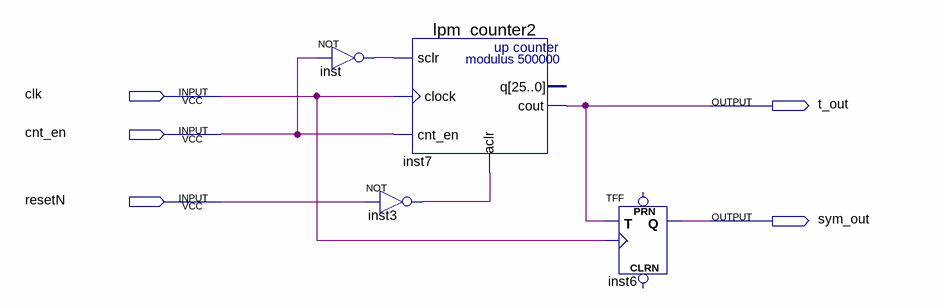
[diagram p0: schematic sheet]
// Quartus schematic secgen.bdf as structural Verilog: 4 symbols, 5 pins
module secgen (
  input  clk,
  input  cnt_en,
  input  resetN,
  output t_out,
  output sym_out
);

  wire inst3_out, inst_out;

  not inst (inst_out, cnt_en);
  lpm_counter2 inst7 (.sclr(inst_out), .clock(clk), .cnt_en(cnt_en), .aclr(inst3_out), .cout(t_out));  // open: q
  not inst3 (inst3_out, resetN);
  TFF inst6 (.T(t_out), .CLK(clk), .Q(sym_out));  // open: PRN, CLRN
endmodule
